# Altium project STC16F40K128.PrjPcb
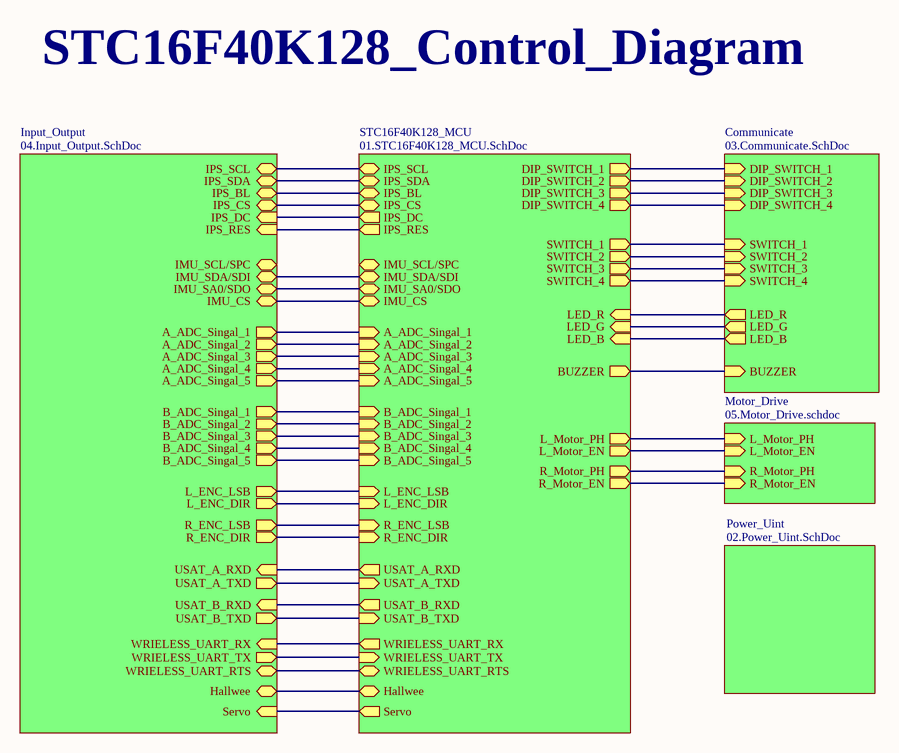
[diagram p0: 00.STC16F40K128.SchDoc]
6 sheets, 158 parts. Net scope: hierarchical (ports join the sheet entries above them; power ports are global).
Board file: STC16F40K128.PcbDoc
Sheets:
  00.STC16F40K128.SchDoc
    STC16F40K128_MCU = 01.STC16F40K128_MCU.SchDoc
    Communicate = 03.Communicate.SchDoc
    Input_Output = 04.Input_Output.SchDoc
    Power_Uint = 02.Power_Uint.SchDoc
    Motor_Drive = 05.Motor_Drive.schdoc

## Sheet 00.STC16F40K128.SchDoc: 00.STC16F40K128_Diagram
size A4; Organization: Altium Limited; Address1: L3, 12a Rodborough Rd; Address2: Frenchs Forest; Address3: NSW; Address4: Australia 2086; Revision: V1; SheetNumber: 1; SheetTotal: 6; Project: STC16F40K128

### Sub-sheets
Communicate = 03.Communicate.SchDoc: DIP_SWITCH_3 (in), DIP_SWITCH_4 (in), DIP_SWITCH_1 (in), DIP_SWITCH_2 (in), SWITCH_3 (in), SWITCH_4 (in), SWITCH_1 (in), SWITCH_2 (in), LED_R (out), LED_G (out), LED_B (out), BUZZER (in)
Input_Output = 04.Input_Output.SchDoc: IMU_SCL/SPC (bidir), IMU_SDA/SDI (bidir), IMU_SA0/SDO (bidir), IMU_CS (bidir), L_ENC_DIR (out), R_ENC_DIR (out), R_ENC_LSB (out), L_ENC_LSB (out), USAT_A_RXD (in), USAT_A_TXD (out), USAT_B_RXD (in), USAT_B_TXD (out), WRIELESS_UART_RX (in), WRIELESS_UART_TX (out), WRIELESS_UART_RTS (bidir), Hallwee (bidir), Servo (in), IPS_SCL (bidir), IPS_RES (in), IPS_SDA (bidir), IPS_CS (bidir), IPS_BL (bidir), IPS_DC (in), B_ADC_Singal_1 (out), B_ADC_Singal_2 (out), B_ADC_Singal_3 (out), B_ADC_Singal_4 (out), B_ADC_Singal_5 (out), A_ADC_Singal_1 (out), A_ADC_Singal_2 (out), A_ADC_Singal_3 (out), A_ADC_Singal_4 (out), A_ADC_Singal_5 (out)
Motor_Drive = 05.Motor_Drive.schdoc: L_Motor_PH (in), L_Motor_EN (in), R_Motor_PH (in), R_Motor_EN (in)
Power_Uint = 02.Power_Uint.SchDoc: no entries
STC16F40K128_MCU = 01.STC16F40K128_MCU.SchDoc: IMU_SCL/SPC (bidir), IMU_SDA/SDI (bidir), IMU_SA0/SDO (bidir), IMU_CS (bidir), L_ENC_LSB (in), L_ENC_DIR (in), R_ENC_LSB (in), R_ENC_DIR (in), DIP_SWITCH_1 (out), DIP_SWITCH_2 (out), DIP_SWITCH_3 (out), DIP_SWITCH_4 (out), SWITCH_1 (out), SWITCH_2 (out), SWITCH_3 (out), SWITCH_4 (out), LED_R (in), LED_G (in), LED_B (in), BUZZER (out), L_Motor_PH (out), L_Motor_EN (out), R_Motor_PH (out), R_Motor_EN (out), USAT_A_TXD (in), USAT_A_RXD (out), USAT_B_TXD (in), USAT_B_RXD (out), WRIELESS_UART_TX (in), WRIELESS_UART_RX (out), WRIELESS_UART_RTS (bidir), Hallwee (bidir), Servo (out), IPS_SCL (bidir), IPS_RES (out), IPS_SDA (bidir), IPS_CS (bidir), IPS_BL (bidir), IPS_DC (out), A_ADC_Singal_1 (in), A_ADC_Singal_2 (in), A_ADC_Singal_3 (in), A_ADC_Singal_4 (in), A_ADC_Singal_5 (in), B_ADC_Singal_1 (in), B_ADC_Singal_2 (in), B_ADC_Singal_3 (in), B_ADC_Singal_4 (in), B_ADC_Singal_5 (in)

### Nets
ADC0_P1.0: sheet STC16F40K128_MCU/B_ADC_Singal_4, sheet Input_Output/B_ADC_Singal_4
ADC1_P1.1: sheet STC16F40K128_MCU/A_ADC_Singal_3, sheet Input_Output/A_ADC_Singal_3
ADC3_P1.3: sheet STC16F40K128_MCU/A_ADC_Singal_1, sheet Input_Output/A_ADC_Singal_1
ADC4_P1.4: sheet STC16F40K128_MCU/B_ADC_Singal_3, sheet Input_Output/B_ADC_Singal_3
ADC5_P1.5: sheet STC16F40K128_MCU/A_ADC_Singal_2, sheet Input_Output/A_ADC_Singal_2
ADC6_P1.6: sheet STC16F40K128_MCU/B_ADC_Singal_2, sheet Input_Output/B_ADC_Singal_2
ADC7_P1.7: sheet STC16F40K128_MCU/B_ADC_Singal_1, sheet Input_Output/B_ADC_Singal_1
ADC10_P0.2: sheet STC16F40K128_MCU/B_ADC_Singal_5, sheet Input_Output/B_ADC_Singal_5
ADC11_P0.3: sheet STC16F40K128_MCU/A_ADC_Singal_5, sheet Input_Output/A_ADC_Singal_5
ADC13_P0.5: sheet STC16F40K128_MCU/A_ADC_Singal_4, sheet Input_Output/A_ADC_Singal_4
BUZZER_P4.0: sheet STC16F40K128_MCU/BUZZER, sheet Communicate/BUZZER
DIP_SWITCH_P0.7: sheet STC16F40K128_MCU/DIP_SWITCH_4, sheet Communicate/DIP_SWITCH_4
DIP_SWITCH_P6.0: sheet STC16F40K128_MCU/DIP_SWITCH_3, sheet Communicate/DIP_SWITCH_3
DIP_SWITCH_P6.1: sheet STC16F40K128_MCU/DIP_SWITCH_2, sheet Communicate/DIP_SWITCH_2
DIP_SWITCH_P6.2: sheet STC16F40K128_MCU/DIP_SWITCH_1, sheet Communicate/DIP_SWITCH_1
Hallwee_P7.1: sheet STC16F40K128_MCU/Hallwee, sheet Input_Output/Hallwee
IMU_P4.1: sheet STC16F40K128_MCU/IMU_SA0/SDO, sheet Input_Output/IMU_SA0/SDO
IMU_P4.2: sheet STC16F40K128_MCU/IMU_SDA/SDI, sheet Input_Output/IMU_SDA/SDI
IMU_P4.3: sheet STC16F40K128_MCU/IMU_CS, sheet Input_Output/IMU_CS
IPS_P2.0: sheet STC16F40K128_MCU/IPS_RES, sheet Input_Output/IPS_RES
IPS_P2.1: sheet STC16F40K128_MCU/IPS_DC, sheet Input_Output/IPS_DC
IPS_P2.2: sheet STC16F40K128_MCU/IPS_CS, sheet Input_Output/IPS_CS
IPS_P2.3: sheet STC16F40K128_MCU/IPS_SDA, sheet Input_Output/IPS_SDA
IPS_P2.5: sheet STC16F40K128_MCU/IPS_SCL, sheet Input_Output/IPS_SCL
IPS_P2.7: sheet STC16F40K128_MCU/IPS_BL, sheet Input_Output/IPS_BL
L_EN_P6.6: sheet STC16F40K128_MCU/L_Motor_EN, sheet Motor_Drive/L_Motor_EN
L_ENC_P0.4: sheet STC16F40K128_MCU/L_ENC_LSB, sheet Input_Output/L_ENC_LSB
L_ENC_P5.2: sheet STC16F40K128_MCU/L_ENC_DIR, sheet Input_Output/L_ENC_DIR
L_PH_P6.7: sheet STC16F40K128_MCU/L_Motor_PH, sheet Motor_Drive/L_Motor_PH
LED_B_P5.1: sheet STC16F40K128_MCU/LED_B, sheet Communicate/LED_B
LED_G_P3.5: sheet STC16F40K128_MCU/LED_G, sheet Communicate/LED_G
LED_R_P7.0: sheet STC16F40K128_MCU/LED_R, sheet Communicate/LED_R
R_EN_P6.4: sheet STC16F40K128_MCU/R_Motor_EN, sheet Motor_Drive/R_Motor_EN
R_ENC_P3.4: sheet STC16F40K128_MCU/R_ENC_LSB, sheet Input_Output/R_ENC_LSB
R_ENC_P5.0: sheet STC16F40K128_MCU/R_ENC_DIR, sheet Input_Output/R_ENC_DIR
R_PH_P6.5: sheet STC16F40K128_MCU/R_Motor_PH, sheet Motor_Drive/R_Motor_PH
RTS_P2.6: sheet STC16F40K128_MCU/WRIELESS_UART_RTS, sheet Input_Output/WRIELESS_UART_RTS
Servo_P3.3: sheet STC16F40K128_MCU/Servo, sheet Input_Output/Servo
SWITCH_P7.4: sheet STC16F40K128_MCU/SWITCH_1, sheet Communicate/SWITCH_1
SWITCH_P7.5: sheet STC16F40K128_MCU/SWITCH_2, sheet Communicate/SWITCH_2
SWITCH_P7.6: sheet STC16F40K128_MCU/SWITCH_3, sheet Communicate/SWITCH_3
SWITCH_P7.7: sheet STC16F40K128_MCU/SWITCH_4, sheet Communicate/SWITCH_4
UART1_RXD_P3.6: sheet STC16F40K128_MCU/USAT_A_TXD, sheet Input_Output/USAT_A_TXD
UART1_TXD_P3.7: sheet STC16F40K128_MCU/USAT_A_RXD, sheet Input_Output/USAT_A_RXD
UART2_RX_P4.6: sheet STC16F40K128_MCU/USAT_B_TXD, sheet Input_Output/USAT_B_TXD
UART2_TX_P4.7: sheet STC16F40K128_MCU/USAT_B_RXD, sheet Input_Output/USAT_B_RXD
UART3_RX_P0.0: sheet STC16F40K128_MCU/WRIELESS_UART_TX, sheet Input_Output/WRIELESS_UART_TX
UART3_TX_P0.1: sheet STC16F40K128_MCU/WRIELESS_UART_RX, sheet Input_Output/WRIELESS_UART_RX

### Notes on the sheet
- STC16F40K128_Control_Diagram
- Title：
- Size:
- Project：
- A4
- Date:
- Revision:
- Author：
- Haibara
- Sheet:
- of:

## Sheet 01.STC16F40K128_MCU.SchDoc: 01.STC16F40K128_MCU
size A4; Organization: Altium Limited; Address1: L3, 12a Rodborough Rd; Address2: Frenchs Forest; Address3: NSW; Address4: Australia 2086; Revision: V1; SheetNumber: 2; SheetTotal: 6; Project: STC16F40K128
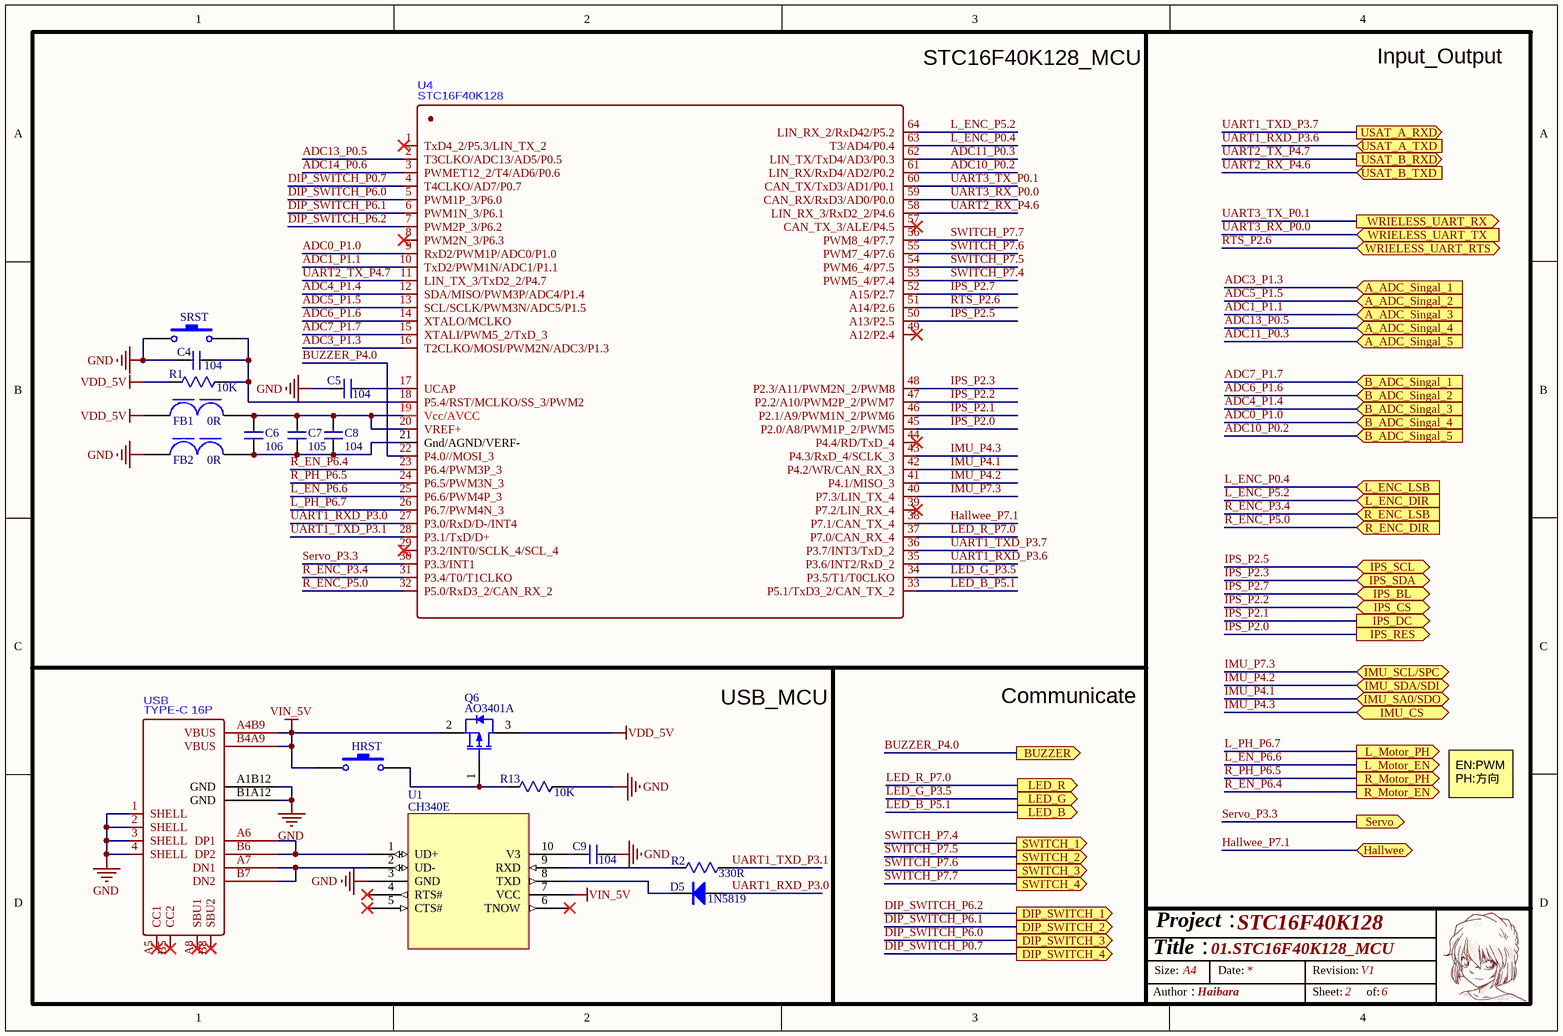
[diagram p1: 01.STC16F40K128_MCU.SchDoc]

### Parts
C4  104  [C0603]
C5  104  [C0603]
C6  106  [C0603]
C7  105  [C0603]
C8  104  [C0603]
C9  104  [C0603]
D5  1N5819  [SOD-523]
FB1  0R  [0805 磁珠 FB3]
FB2  0R  [0805 磁珠 FB3]
HRST  SW-PB  [TSW SMD-3*6*2.5]  (value not drawn)
Q6  AO3401A  [AO-SOT-23-3L_V]
R1  10K  [R0603]
R2  330R  [R0603]
R13  10K  [R0603]
SRST  SW-PB  [TSW SMD-3*6*2.5]  (value not drawn)
U1  CH340E  [MSOP10]
U4  STC16F40K128  [LQFP-64_L10.0-W10.0-P0.50-LS12.0-BL]
USB  TYPE-C 16P  [USB-C-SMD_TYPE-C16PIN_C668624]

### Ports
A_ADC_Singal_1 (in), A_ADC_Singal_2 (in), A_ADC_Singal_3 (in), A_ADC_Singal_4 (in), A_ADC_Singal_5 (in), B_ADC_Singal_1 (in), B_ADC_Singal_2 (in), B_ADC_Singal_3 (in), B_ADC_Singal_4 (in), B_ADC_Singal_5 (in), BUZZER (out), DIP_SWITCH_1 (out), DIP_SWITCH_2 (out), DIP_SWITCH_3 (out), DIP_SWITCH_4 (out), Hallwee (bidir), IMU_CS (bidir), IMU_SA0/SDO (bidir), IMU_SCL/SPC (bidir), IMU_SDA/SDI (bidir), IPS_BL (bidir), IPS_CS (bidir), IPS_DC (out), IPS_RES (out), IPS_SCL (bidir), IPS_SDA (bidir), L_ENC_DIR (in), L_ENC_LSB (in), L_Motor_EN (out), L_Motor_PH (out), LED_B (out), LED_G (out), LED_R (out), R_ENC_DIR (in), R_ENC_LSB (in), R_Motor_EN (out), R_Motor_PH (out), Servo (out), SWITCH_1 (out), SWITCH_2 (out), SWITCH_3 (out), SWITCH_4 (out), USAT_A_RXD (out), USAT_A_TXD (in), USAT_B_RXD (out), USAT_B_TXD (in), WRIELESS_UART_RTS (bidir), WRIELESS_UART_RX (out), WRIELESS_UART_TX (in)

### Nets
GND: C4.1 C5.2 C9.1 FB2.1 R13.2 SRST.1 U1.3(GND) USB.1(SHELL) USB.2(SHELL) USB.3(SHELL) USB.4(SHELL) USB.A1B12(GND) USB.B1A12(GND)
VDD_5V: FB1.1 Q6.3(DRAIN) R1.1
VIN_5V: HRST.1 Q6.2(SOURCE) U1.7(VCC) USB.A4B9(VBUS) USB.B4A9(VBUS)
ADC0_P1.0: U4.9(RxD2/PWM1P/ADC0/P1.0) ; port B_ADC_Singal_4
ADC1_P1.1: U4.10(TxD2/PWM1N/ADC1/P1.1) ; port A_ADC_Singal_3
ADC3_P1.3: U4.16(T2CLKO/MOSI/PWM2N/ADC3/P1.3) ; port A_ADC_Singal_1
ADC4_P1.4: U4.12(SDA/MISO/PWM3P/ADC4/P1.4) ; port B_ADC_Singal_3
ADC5_P1.5: U4.13(SCL/SCLK/PWM3N/ADC5/P1.5) ; port A_ADC_Singal_2
ADC6_P1.6: U4.14(XTALO/MCLKO) ; port B_ADC_Singal_2
ADC7_P1.7: U4.15(XTALI/PWM5_2/TxD_3) ; port B_ADC_Singal_1
ADC10_P0.2: U4.61(LIN_RX/RxD4/AD2/P0.2) ; port B_ADC_Singal_5
ADC11_P0.3: U4.62(LIN_TX/TxD4/AD3/P0.3) ; port A_ADC_Singal_5
ADC13_P0.5: U4.2(T3CLKO/ADC13/AD5/P0.5) ; port A_ADC_Singal_4
ADC14_P0.6: U4.3(PWMET12_2/T4/AD6/P0.6)
BUZZER_P4.0: U4.22(P4.0//MOSI_3) ; port BUZZER
DIP_SWITCH_P0.7: U4.4(T4CLKO/AD7/P0.7) ; port DIP_SWITCH_4
DIP_SWITCH_P6.0: U4.5(PWM1P_3/P6.0) ; port DIP_SWITCH_3
DIP_SWITCH_P6.1: U4.6(PWM1N_3/P6.1) ; port DIP_SWITCH_2
DIP_SWITCH_P6.2: U4.7(PWM2P_3/P6.2) ; port DIP_SWITCH_1
Hallwee_P7.1: U4.38(P7.1/CAN_TX_4) ; port Hallwee
IMU_P4.1: U4.42(P4.2/WR/CAN_RX_3) ; port IMU_SA0/SDO
IMU_P4.2: U4.41(P4.1/MISO_3) ; port IMU_SDA/SDI
IMU_P4.3: U4.43(P4.3/RxD_4/SCLK_3) ; port IMU_CS
IMU_P7.3: U4.40(P7.3/LIN_TX_4) ; port IMU_SCL/SPC
IPS_P2.0: U4.45(P2.0/A8/PWM1P_2/PWM5) ; port IPS_RES
IPS_P2.1: U4.46(P2.1/A9/PWM1N_2/PWM6) ; port IPS_DC
IPS_P2.2: U4.47(P2.2/A10/PWM2P_2/PWM7) ; port IPS_CS
IPS_P2.3: U4.48(P2.3/A11/PWM2N_2/PWM8) ; port IPS_SDA
IPS_P2.5: U4.50(A13/P2.5) ; port IPS_SCL
IPS_P2.7: U4.52(A15/P2.7) ; port IPS_BL
L_EN_P6.6: U4.25(P6.6/PWM4P_3) ; port L_Motor_EN
L_ENC_P0.4: U4.63(T3/AD4/P0.4) ; port L_ENC_LSB
L_ENC_P5.2: U4.64(LIN_RX_2/RxD42/P5.2) ; port L_ENC_DIR
L_PH_P6.7: U4.26(P6.7/PWM4N_3) ; port L_Motor_PH
LED_B_P5.1: U4.33(P5.1/TxD3_2/CAN_TX_2) ; port LED_B
LED_G_P3.5: U4.34(P3.5/T1/T0CLKO) ; port LED_G
LED_R_P7.0: U4.37(P7.0/CAN_RX_4) ; port LED_R
R_EN_P6.4: U4.23(P6.4/PWM3P_3) ; port R_Motor_EN
R_ENC_P3.4: U4.31(P3.4/T0/T1CLKO) ; port R_ENC_LSB
R_ENC_P5.0: U4.32(P5.0/RxD3_2/CAN_RX_2) ; port R_ENC_DIR
R_PH_P6.5: U4.24(P6.5/PWM3N_3) ; port R_Motor_PH
RTS_P2.6: U4.51(A14/P2.6) ; port WRIELESS_UART_RTS
Servo_P3.3: U4.30(P3.3/INT1) ; port Servo
SWITCH_P7.4: U4.53(PWM5_4/P7.4) ; port SWITCH_1
SWITCH_P7.5: U4.54(PWM6_4/P7.5) ; port SWITCH_2
SWITCH_P7.6: U4.55(PWM7_4/P7.6) ; port SWITCH_3
SWITCH_P7.7: U4.56(PWM8_4/P7.7) ; port SWITCH_4
UART1_RXD_P3.0: D5.1(A) U4.27(P3.0/RxD/D-/INT4)
UART1_RXD_P3.6: U4.35(P3.6/INT2/RxD_2) ; port USAT_A_TXD
UART1_TXD_P3.1: R2.1 U4.28(P3.1/TxD/D+)
UART1_TXD_P3.7: U4.36(P3.7/INT3/TxD_2) ; port USAT_A_RXD
UART2_RX_P4.6: U4.58(LIN_RX_3/RxD2_2/P4.6) ; port USAT_B_TXD
UART2_TX_P4.7: U4.11(LIN_TX_3/TxD2_2/P4.7) ; port USAT_B_RXD
UART3_RX_P0.0: U4.59(CAN_RX/RxD3/AD0/P0.0) ; port WRIELESS_UART_TX
UART3_TX_P0.1: U4.60(CAN_TX/TxD3/AD1/P0.1) ; port WRIELESS_UART_RX
NetC4_2: C4.2 R1.2 SRST.2 U4.18(P5.4/RST/MCLKO/SS_3/PWM2)
NetC5_1: C5.1 U4.17(UCAP)
NetC6_1: C6.1 C7.1 C8.1 FB2.2 U4.21(Gnd/AGND/VERF-)
NetC6_2: C6.2 C7.2 C8.2 FB1.2 U4.19(Vcc/AVCC) U4.20(VREF+)
NetC9_2: C9.2 U1.10(V3)
NetD5_2: D5.2(K) U1.8(TXD)
NetHRST_2: HRST.2 Q6.1(GATE) R13.1
NetR2_2: R2.2 U1.9(RXD)
NetU1_1: U1.1(UD+) USB.A6(DP1) USB.B6(DP2)
NetU1_2: U1.2(UD-) USB.A7(DN1) USB.B7(DN2)

Not connected (* = marked no-connect by the designer): U1 4(RTS#)* 5(CTS#)* 6(TNOW)*; U4 1(TxD4_2/P5.3/LIN_TX_2)* 8(PWM2N_3/P6.3)* 29(P3.2/INT0/SCLK_4/SCL_4)* 39(P7.2/LIN_RX_4)* 44(P4.4/RD/TxD_4)* 49(A12/P2.4)* 57(CAN_TX_3/ALE/P4.5)*; USB A5(CC1)* A8(SBU1)* B5(CC2)* B8(SBU2)*

### Notes on the sheet
- STC16F40K128_MCU
- Input_Output
- USB_MCU
- Communicate
- EN:PWM
  PH:方向
- Title：
- Size:
- Project：
- A4
- Date:
- Revision:
- Author：
- Haibara
- Sheet:
- of:

### Library data of the parts
C4-C9 = 电容
D5 = 1N5819: 肖特基二极管; 淘宝ID: 黄晶宝石; 属性: 40V/2A; BOM名称: 肖特基二极管; 欢迎光临: https://shop463601444.taobao.com
FB1 FB2 = FB
HRST SRST = SW-PB: Switch; Published: 24-Mar-1999; LatestRevisionDate: 17-Jul-2002; LatestRevisionNote: Re-released for DXP Platform.; PackageReference: SPST-2; Publisher: Altium Limited; PackageDescription: Switch; 2 Leads
Q6 = CMP-2000-05778-1: P-Channel MOSFET, 30 V, 4 A, -55 to 150 degC, 3-Pin SOT-23-3L, RoHS, Tape and Reel; Manufacturer: Alpha and Omega; Output Power (Max): NotRequiredW; Power Dissipation: 1.4W; Rad Hardened: No; Drain Efficiency: NotRequired%; Drain-Source On-Volt: 30V; Noise Figure: NotRequireddB; Frequency (Max): NotRequiredMHz; Number of  Elements: 1; Gate-Source Voltage (Max): ?12V; Drain Current (Max): 4A; Channel Mode: Enhancement; Drain-Source On-Res: 0.044ohm; Type: PowerMOSFET; Polarity: P; Package URL: http://www.aosmd.com/res/packaging_information/SOT-23-3L.pdf; Datasheet URL: http://www.aosmd.com/res/data_sheets/AO3401A.pdf; Package Type: SOT-23; Package Description: 3-Pin Small Outline Transistor, Body 2.95 x 1.6 mm, Pitch 0.95 mm; Mounting: SurfaceMount; Manufacturer URL: http://www.aosmd.com/; Continuous Drain Current: 4A; Package Reference: SOT-23-3L; Mounting Technology: SurfaceMount; Operating Temperature Classification: Military; Power Gain: NotRequireddB; Datasheet Version: Rev. 3, 03/2011; Operating Temp Range: -55Cto150C; Pin Count: 3
R1 R2 R13 = 电阻
U1 = CH340E: USB to TTL Serial / UART

## Sheet 03.Communicate.SchDoc: 03.Communicate
size A4; Organization: Altium Limited; Address1: L3, 12a Rodborough Rd; Address2: Frenchs Forest; Address3: NSW; Address4: Australia 2086; Revision: V1; SheetNumber: 4; SheetTotal: 6; Project: STC16F40K128
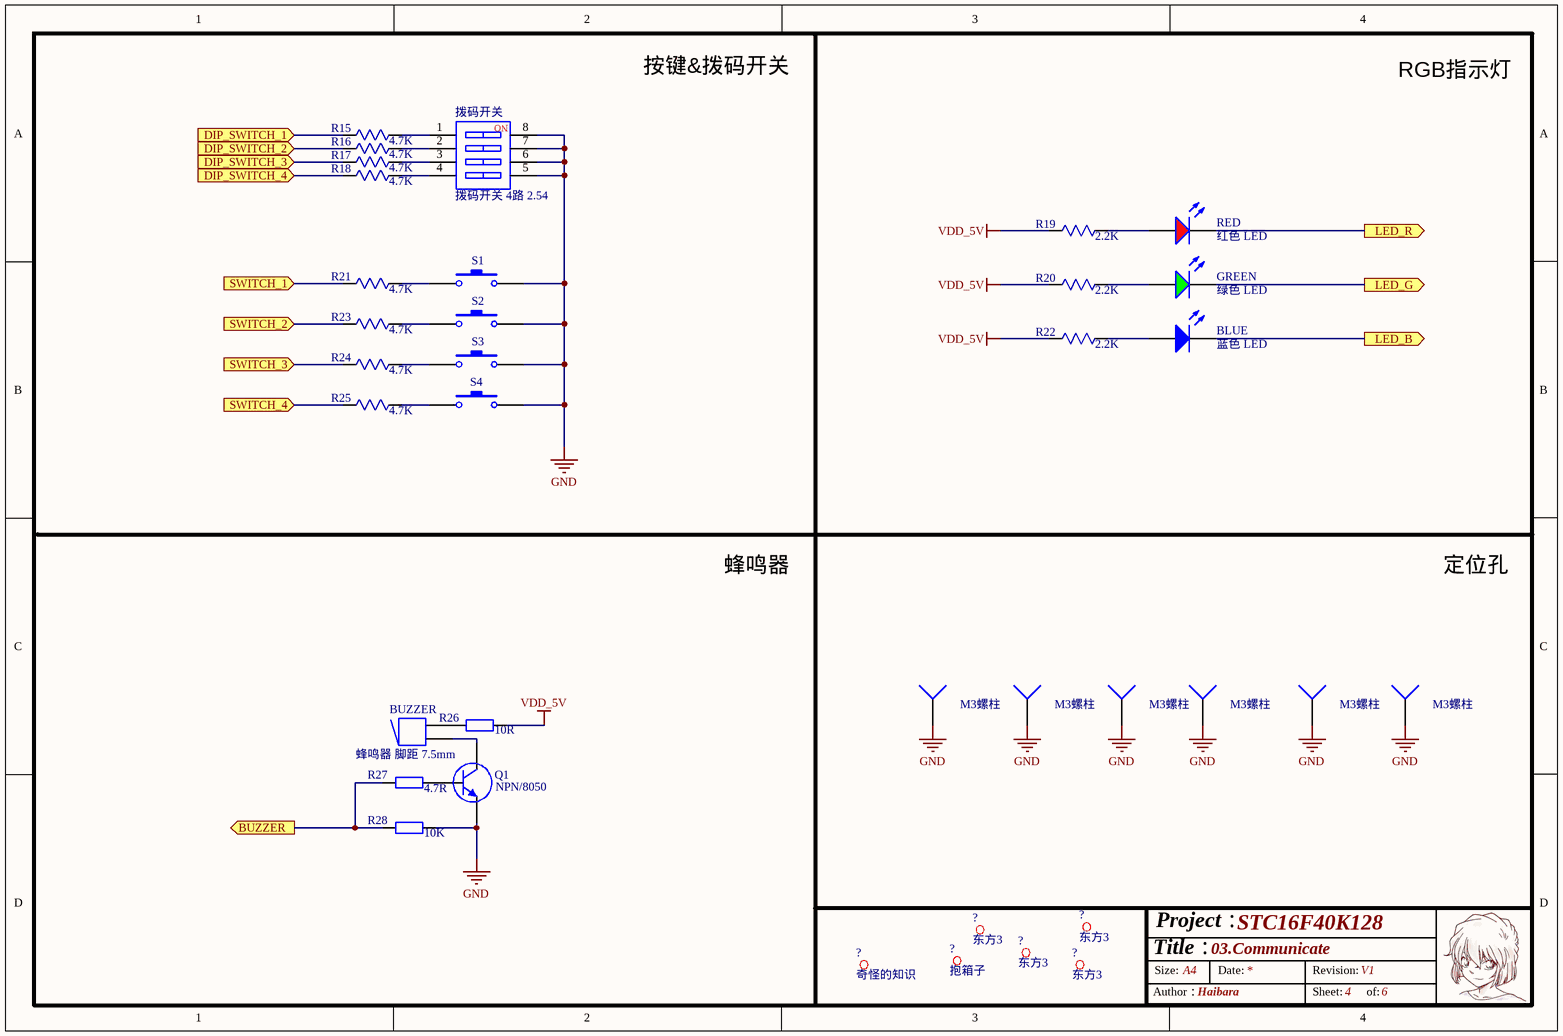
[diagram p2: 03.Communicate.SchDoc]

### Parts
(Parts that share a designator on the sheet are numbered #1, #2 ... from top to bottom, then left to right.)
?#1  东方3  [FKt]
?#2  东方3  [ESD]
?#3  奇怪的知识  [奇怪的知识]
?#4  抱箱子  [抱箱子_大]
?#5  东方3  [IMPORTED_IMAGE - duplicate15]
?#6  东方3  [IEC_HotSurface_Small]
BLUE  蓝色 LED  [0603 LED B]
BUZZER  蜂鸣器 脚距 7.5mm  [蜂鸣器5.5mm脚距]
GREEN  绿色 LED  [0603 LED G]
J1  M3螺柱  [MTGP720H320V6P - duplicate]
J2  M3螺柱  [MTGP720H320V6P - duplicate]
J3  M3螺柱  [MTGP720H320V6P - duplicate]
J4  M3螺柱  [MTGP720H320V6P - duplicate]
J5  M3螺柱  [MTGP720H320V6P - duplicate]
J6  M3螺柱  [MTGP720H320V6P - duplicate]
Q1  NPN/8050  [SOT232-3 三极管]
R15  4.7K  [R0603]
R16  4.7K  [R0603]
R17  4.7K  [R0603]
R18  4.7K  [R0603]
R19  2.2K  [R0603]
R20  2.2K  [R0603]
R21  4.7K  [R0603]
R22  2.2K  [R0603]
R23  4.7K  [R0603]
R24  4.7K  [R0603]
R25  4.7K  [R0603]
R26  value 10R  [0603 电阻 R3]  (hidden comment: 4.7K)
R27  value 4.7R  [0603 电阻 R3]  (hidden comment: 4.7K)
R28  value 10K  [0603 电阻 R3]  (hidden comment: 4.7K)
RED  红色 LED  [0603 LED R]
S1  SW-PB  [TSW SMD-3*6*2.5]  (value not drawn)
S2  SW-PB  [TSW SMD-3*6*2.5]  (value not drawn)
S3  SW-PB  [TSW SMD-3*6*2.5]  (value not drawn)
S4  SW-PB  [TSW SMD-3*6*2.5]  (value not drawn)
拨码开关  拨码开关 4路 2.54  [CSW DIP-2P_G]

### Ports
BUZZER (out), DIP_SWITCH_1 (in), DIP_SWITCH_2 (in), DIP_SWITCH_3 (in), DIP_SWITCH_4 (in), LED_B (out), LED_G (out), LED_R (out), SWITCH_1 (in), SWITCH_2 (in), SWITCH_3 (in), SWITCH_4 (in)

### Nets
GND: J1.1 J2.1 J3.1 J4.1 J5.1 J6.1 Q1.2(E) R28.2 S1.2 S2.2 S3.2 S4.2 拨码开关.5 拨码开关.6 拨码开关.7 拨码开关.8
VDD_5V: R19.1 R20.1 R22.1 R26.2
BUZZER_P4.0: R27.1 R28.1 ; port BUZZER
DIP_SWITCH_P0.7: R18.1 ; port DIP_SWITCH_4
DIP_SWITCH_P6.0: R17.1 ; port DIP_SWITCH_3
DIP_SWITCH_P6.1: R16.1 ; port DIP_SWITCH_2
DIP_SWITCH_P6.2: R15.1 ; port DIP_SWITCH_1
LED_B_P5.1: BLUE.2 ; port LED_B
LED_G_P3.5: GREEN.2 ; port LED_G
LED_R_P7.0: RED.2 ; port LED_R
SWITCH_P7.4: R21.1 ; port SWITCH_1
SWITCH_P7.5: R23.1 ; port SWITCH_2
SWITCH_P7.6: R24.1 ; port SWITCH_3
SWITCH_P7.7: R25.1 ; port SWITCH_4
NetBLUE_1: BLUE.1 R22.2
NetBUZZER_1: BUZZER.1 R26.1
NetBUZZER_2: BUZZER.2 Q1.3(C)
NetGREEN_1: GREEN.1 R20.2
NetQ1_1: Q1.1(B) R27.2
NetR15_2: R15.2 拨码开关.1
NetR16_2: R16.2 拨码开关.2
NetR17_2: R17.2 拨码开关.3
NetR18_2: R18.2 拨码开关.4
NetR19_2: R19.2 RED.1
NetR21_2: R21.2 S1.1
NetR23_2: R23.2 S2.1
NetR24_2: R24.2 S3.1
NetR25_2: R25.2 S4.1

### Notes on the sheet
- 按键&拨码开关
- RGB指示灯
- 蜂鸣器
- 定位孔
- Title：
- Size:
- Project：
- A4
- Date:
- Revision:
- Author：
- Haibara
- Sheet:
- of:
- (in symbol CSW-4P) NO

### Library data of the parts
BLUE = 蓝灯: 发光二极管; ComponentLink1Description: 供应商链接; ComponentLink1URL: http://www.szlcsc.com/product/details_2666.html; Package: 0805; Supplier: LC; SuppliersPartNumber: C2293
BUZZER = Buzzer: Magnetic Transducer Buzzer; Published: 24-Mar-1999; LatestRevisionDate: 17-Dec-2003; LatestRevisionNote: Schematic revised, PCB Footprint replaced.; DatasheetVersion: 17-Dec-2003; PackageReference: ABSM-1574; Publisher: Altium Limited; PackageDescription: Magnetic Transducer Buzzer; ComponentLink1Description: Manufacturer Link; ComponentLink1URL: http://www.megastar.com/linecard/buzzmode/index.php
GREEN = 绿灯: 发光二极管; ComponentLink1Description: 供应商链接; ComponentLink1URL: http://www.szlcsc.com/product/details_2670.html; Package: 0805; Supplier: LC; SuppliersPartNumber: C2297
J1-J6 = Socket: LatestRevisionDate: 17-Jul-2002; LatestRevisionNote: Re-released for DXP Platform.; Publisher: Altium Limited
R15-R25 = 电阻
R26-R28 = Res2: Resistor; Published: 8-Jun-2000; LatestRevisionDate: 17-Jul-2002; LatestRevisionNote: Re-released for DXP Platform.; PackageReference: AXIAL-0.4; Publisher: Altium Limited; PackageDescription: Axial Device, Thru-Hole; 2 Leads; 0.4 in Pin Spacing
RED = 红灯: 发光二极管; ComponentLink1Description: 供应商链接; ComponentLink1URL: http://www.szlcsc.com/product/details_2668.html; Package: 0805; Supplier: LC; SuppliersPartNumber: C2295
S1-S4 = SW-PB: Switch; Published: 24-Mar-1999; LatestRevisionDate: 17-Jul-2002; LatestRevisionNote: Re-released for DXP Platform.; PackageReference: SPST-2; Publisher: Altium Limited; PackageDescription: Switch; 2 Leads
拨码开关 = CSW-4P: 4路编码开关; 版权归属: 源创客; BOM名称: 4路编码开关; 学习资源: www.ooocke.com

## Sheet 04.Input_Output.SchDoc: 04.Input_Output
size A4; Organization: Altium Limited; Address1: L3, 12a Rodborough Rd; Address2: Frenchs Forest; Address3: NSW; Address4: Australia 2086; Revision: V1; SheetNumber: 5; SheetTotal: 6; Project: STC16F40K128
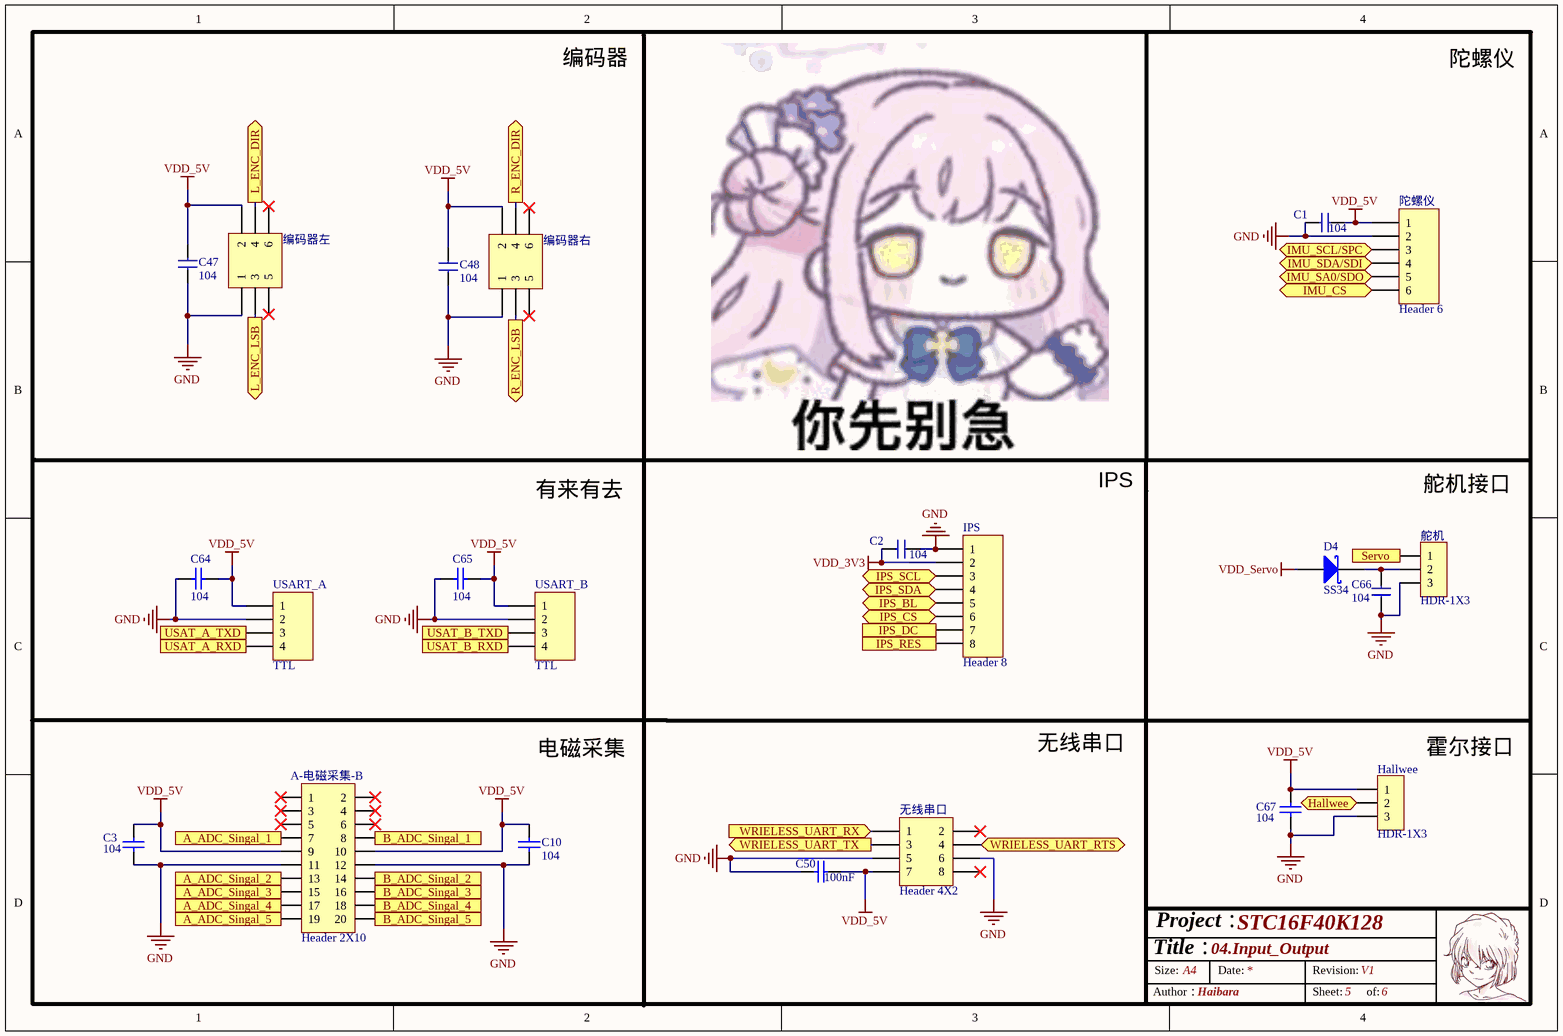
[diagram p3: 04.Input_Output.SchDoc]

### Parts
A-电磁采集-B  Header 2X10  [HDR2.54-LI-2x10P]
C1  104  [C0603]
C2  104  [C0603]
C3  104  [0603 电容 C3]
C10  104  [0603 电容 C3]
C47  104  [C0603]
C48  104  [C0603]
C50  100nF  [0603 电容 C3]
C64  104  [0603 电容 C3]
C65  104  [0603 电容 C3]
C66  104  [C0603]
C67  104  [0603 电容 C3]
D4  SS34  [SMA]
Hallwee  HDR-1X3  [HDR2.54-M-LI-3P]
IPS  Header 8  [HDR2.54-M-LI-8P]
USART_A  TTL  [HDR2.54-M-LI-4P]
USART_B  TTL  [HDR2.54-M-LI-4P]
无线串口  Header 4X2  [2.54mm 4P*2排母]
编码器右  Header 3X2  [DC-2.54-L-Z-6P]  (value not drawn)
编码器左  Header 3X2  [DC-2.54-L-Z-6P]  (value not drawn)
舵机  HDR-1X3  [HDR2.54-M-LI-3P]
陀螺仪  Header 6  [MX 1.25-WS-6P]

### Ports
A_ADC_Singal_1 (out), A_ADC_Singal_2 (out), A_ADC_Singal_3 (out), A_ADC_Singal_4 (out), A_ADC_Singal_5 (out), B_ADC_Singal_1 (out), B_ADC_Singal_2 (out), B_ADC_Singal_3 (out), B_ADC_Singal_4 (out), B_ADC_Singal_5 (out), Hallwee (bidir), IMU_CS (bidir), IMU_SA0/SDO (bidir), IMU_SCL/SPC (bidir), IMU_SDA/SDI (bidir), IPS_BL (bidir), IPS_CS (bidir), IPS_DC (out), IPS_RES (out), IPS_SCL (bidir), IPS_SDA (bidir), L_ENC_DIR (out), L_ENC_LSB (out), R_ENC_DIR (out), R_ENC_LSB (out), Servo (in), USAT_A_RXD (in), USAT_A_TXD (out), USAT_B_RXD (in), USAT_B_TXD (out), WRIELESS_UART_RTS (bidir), WRIELESS_UART_RX (in), WRIELESS_UART_TX (out)

### Nets
GND: A-电磁采集-B.11 A-电磁采集-B.12 C1.2 C2.2 C3.1 C10.1 C47.1 C48.1 C50.2 C64.2 C65.2 C66.1 C67.1 Hallwee.3 IPS.1 USART_A.2 USART_B.2 无线串口.5 无线串口.6 编码器右.1 编码器左.1 舵机.3 陀螺仪.2
VDD_3V3: C2.1 IPS.2
VDD_5V: A-电磁采集-B.9 A-电磁采集-B.10 C1.1 C3.2 C10.2 C47.2 C48.2 C50.1 C64.1 C65.1 C67.2 Hallwee.1 USART_A.1 USART_B.1 无线串口.7 编码器右.2 编码器左.2 陀螺仪.1
VDD_Servo: D4.1(A)
ADC0_P1.0: A-电磁采集-B.18 ; port B_ADC_Singal_4
ADC1_P1.1: A-电磁采集-B.15 ; port A_ADC_Singal_3
ADC3_P1.3: A-电磁采集-B.7 ; port A_ADC_Singal_1
ADC4_P1.4: A-电磁采集-B.16 ; port B_ADC_Singal_3
ADC5_P1.5: A-电磁采集-B.13 ; port A_ADC_Singal_2
ADC6_P1.6: A-电磁采集-B.14 ; port B_ADC_Singal_2
ADC7_P1.7: A-电磁采集-B.8 ; port B_ADC_Singal_1
ADC10_P0.2: A-电磁采集-B.20 ; port B_ADC_Singal_5
ADC11_P0.3: A-电磁采集-B.19 ; port A_ADC_Singal_5
ADC13_P0.5: A-电磁采集-B.17 ; port A_ADC_Singal_4
Hallwee_P7.1: Hallwee.2 ; port Hallwee
IMU_P4.1: 陀螺仪.5 ; port IMU_SA0/SDO
IMU_P4.2: 陀螺仪.4 ; port IMU_SDA/SDI
IMU_P4.3: 陀螺仪.6 ; port IMU_CS
IPS_P2.0: IPS.8 ; port IPS_RES
IPS_P2.1: IPS.7 ; port IPS_DC
IPS_P2.2: IPS.6 ; port IPS_CS
IPS_P2.3: IPS.4 ; port IPS_SDA
IPS_P2.5: IPS.3 ; port IPS_SCL
IPS_P2.7: IPS.5 ; port IPS_BL
L_ENC_P0.4: 编码器左.3 ; port L_ENC_LSB
L_ENC_P5.2: 编码器左.4 ; port L_ENC_DIR
R_ENC_P3.4: 编码器右.3 ; port R_ENC_LSB
R_ENC_P5.0: 编码器右.4 ; port R_ENC_DIR
RTS_P2.6: 无线串口.4 ; port WRIELESS_UART_RTS
Servo_P3.3: 舵机.1 ; port Servo
UART1_RXD_P3.6: USART_A.3 ; port USAT_A_TXD
UART1_TXD_P3.7: USART_A.4 ; port USAT_A_RXD
UART2_RX_P4.6: USART_B.3 ; port USAT_B_TXD
UART2_TX_P4.7: USART_B.4 ; port USAT_B_RXD
UART3_RX_P0.0: 无线串口.3 ; port WRIELESS_UART_TX
UART3_TX_P0.1: 无线串口.1 ; port WRIELESS_UART_RX
NetC66_2: C66.2 D4.2(K) 舵机.2
Net陀螺仪_3: 陀螺仪.3 ; port IMU_SCL/SPC

Not connected (* = marked no-connect by the designer): A-电磁采集-B 1* 2* 3* 4* 5* 6*; 无线串口 2* 8*; 编码器右 5* 6*; 编码器左 5* 6*

### Notes on the sheet
- Labels drawn without touching a wire or pin: IPS, 无线串口, 有来有去, 电磁采集, 编码器, 舵机接口, 陀螺仪, 霍尔接口
- Title：
- Size:
- Project：
- A4
- Date:
- Revision:
- Author：
- Haibara
- Sheet:
- of:

### Library data of the parts
A-电磁采集-B = Header 10X2: 10*2P接插件; 版权归属: 源创客; BOM名称: 10*2P接插件; 学习资源: www.ooocke.com
C1 C2 C47 C48 C66 = 电容
C3 C10 C50 C64 C65 C67 = Cap: Capacitor; Published: 8-Jun-2000; LatestRevisionDate: 17-Jul-2002; LatestRevisionNote: Re-released for DXP Platform.; PackageReference: RAD-0.3; Publisher: Altium Limited; PackageDescription: Radial Cap, Thru-Hole; 2 Leads; 0.3 in Pin Spacing
D4 = 肖特基二极管: Schottky Rectifier; Note: Terminal 2 is the TAB and is electrically connected to the cathode; Published: 8-Jun-2000; LatestRevisionDate: 17-Jul-2002; LatestRevisionNote: Re-released for DXP Platform.; DatasheetVersion: PD-2.057B; PackageVersion: Feb-1998; PackageReference: TO-220AC; Publisher: Altium Limited; PackageDescription: TO, Thru-Hole, Vertical, Heatsink Mounted; 3 In-Line Leads (1 Absent); Pitch 2.54 mm; ComponentLink1Description: Manufacturer Link; ComponentLink1URL: http://www.irf.com/; ComponentLink2Description: Datasheet; ComponentLink2URL: http://www.irf.com/product-info/datasheets/data/10tq.pdf
Hallwee 舵机 = Header 3: 3P接插件; 版权归属: 封装库来自淘宝 ID：黄晶宝石; BOM名称: 3P接插件; 学习资源: https://shop463601444.taobao.com
IPS = Header 8: Header, 8-Pin; LatestRevisionDate: 17-Jul-2002; LatestRevisionNote: Re-released for DXP Platform.; Publisher: Altium Limited
USART_A USART_B = Header 4: Header, 4-Pin; LatestRevisionDate: 17-Jul-2002; LatestRevisionNote: Re-released for DXP Platform.; Publisher: Altium Limited
无线串口 = Header 4X2: Header, 4-Pin, Dual row; LatestRevisionDate: 17-Jul-2002; LatestRevisionNote: Re-released for DXP Platform.; Publisher: Altium Limited
编码器右 编码器左 = Header 3X2: Header, 3-Pin, Dual row; LatestRevisionDate: 17-Jul-2002; LatestRevisionNote: Re-released for DXP Platform.; Publisher: Altium Limited
陀螺仪 = Header 6: Header, 6-Pin; LatestRevisionDate: 17-Jul-2002; LatestRevisionNote: Re-released for DXP Platform.; Publisher: Altium Limited

## Sheet 02.Power_Uint.SchDoc: 02.Power_Uint
size A4; Organization: Altium Limited; Address1: L3, 12a Rodborough Rd; Address2: Frenchs Forest; Address3: NSW; Address4: Australia 2086; Revision: V1; SheetNumber: 3; SheetTotal: 6; Project: STC16F40K128
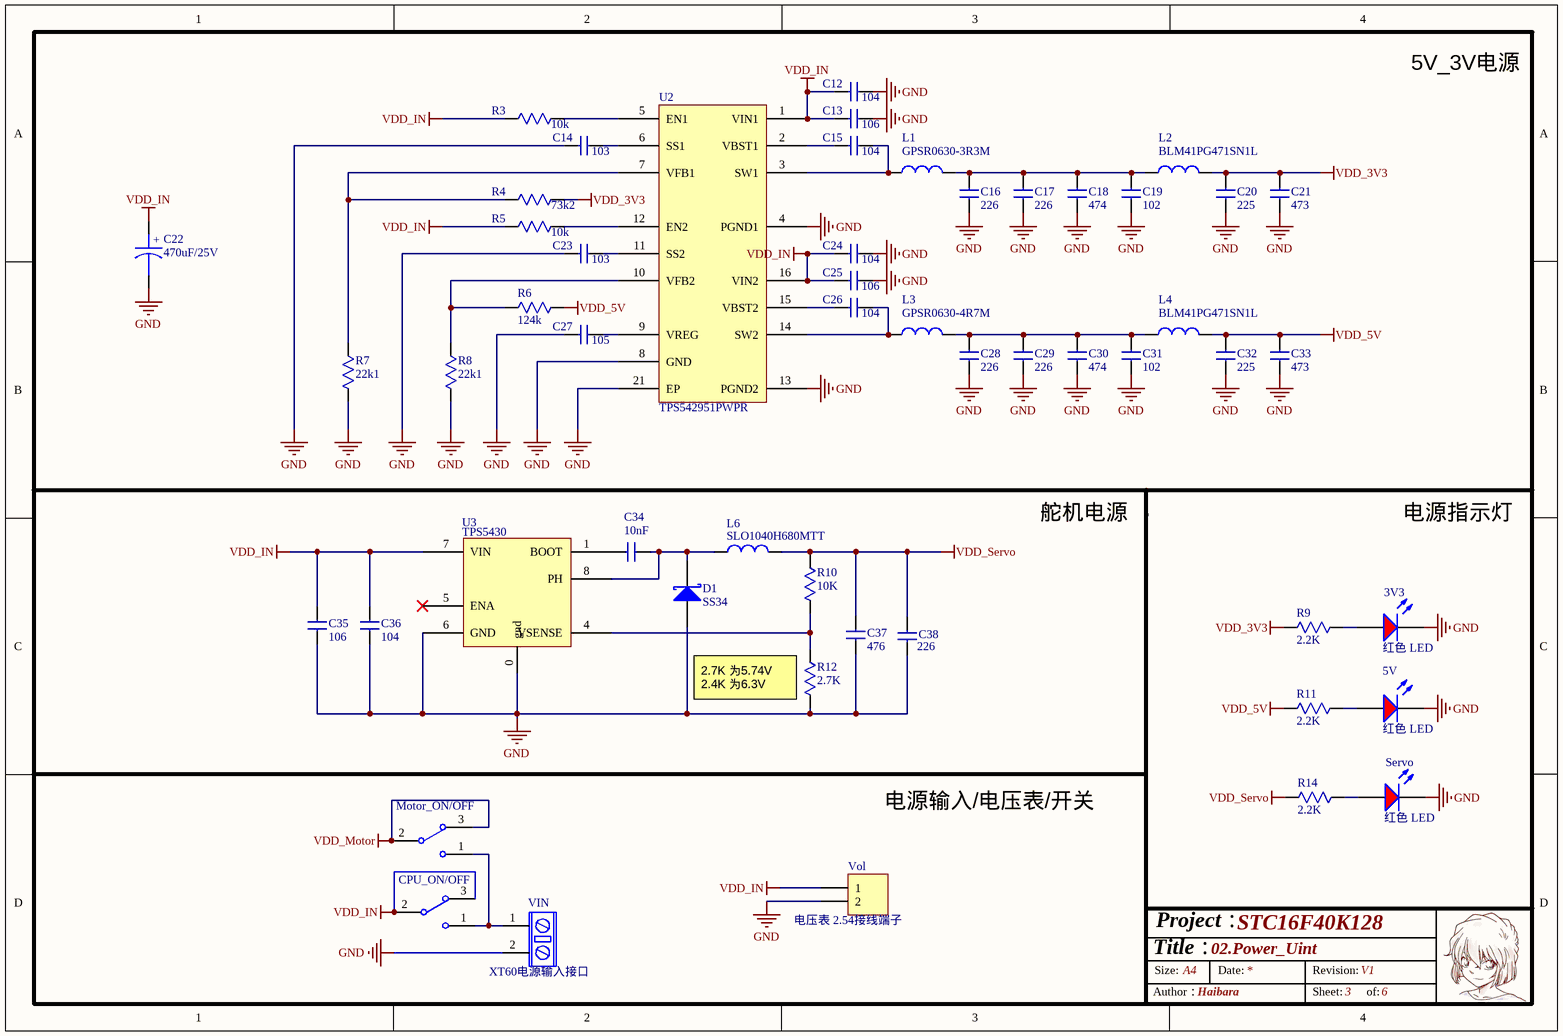
[diagram p4: 02.Power_Uint.SchDoc]

### Parts
3V3  红色 LED  [0603 LED R]
5V  红色 LED  [0603 LED R]
C12  104  [C0603]
C13  106  [C0805]
C14  103  [C0603]
C15  104  [C0805]
C16  226  [C0805]
C17  226  [C0805]
C18  474  [C0603]
C19  102  [C0603]
C20  225  [C0603]
C21  473  [C0603]
C22  470uF/25V  [CAP 2.5*6.3*11.2]
C23  103  [C0603]
C24  104  [C0603]
C25  106  [C0805]
C26  104  [C0805]
C27  105  [C0603]
C28  226  [C0805]
C29  226  [C0805]
C30  474  [C0603]
C31  102  [C0603]
C32  225  [C0603]
C33  473  [C0603]
C34  10nF  [C0603]
C35  106  [C0805]
C36  104  [C0603]
C37  476  [C0805]
C38  226  [C0805]
CPU_ON/OFF  SW-SPDT  [MTS-102S 两档纽子开关]  (value not drawn)
D1  SS34  [SMA]
L1  GPSR0630-3R3M  [L 0630]
L2  BLM41PG471SN1L  [R1206]
L3  GPSR0630-4R7M  [L 0630]
L4  BLM41PG471SN1L  [R1206]
L6  SLO1040H680MTT  [IND-SMD_L10.8-W10.0]
Motor_ON/OFF  SW-SPDT  [MTS-102S 两档纽子开关]  (value not drawn)
R3  10k  [R0603]
R4  73k2  [R0603]
R5  10k  [R0603]
R6  124k  [R0603]
R7  22k1  [R0603]
R8  22k1  [R0603]
R9  2.2K  [R0603]
R10  10K  [R0603]
R11  2.2K  [R0603]
R12  2.7K  [R0603]
R14  2.2K  [R0603]
Servo  红色 LED  [0603 LED R]
U2  TPS542951PWPR  [SSOP16_EP]
U3  TPS5430  [LC-SOP-8_EP_150mil]
VIN  XT60电源输入接口  [XT60 母头 电源接口]
Vol  电压表 2.54接线端子  [XH2.54-LI-2P]

### Nets
GND: 3V3.2 5V.2 C12.2 C13.2 C14.1 C16.1 C17.1 C18.1 C19.1 C20.1 C21.1 C22.2 C23.1 C24.2 C25.2 C27.1 C28.1 C29.1 C30.1 C31.1 C32.1 C33.1 C35.1 C36.1 C37.1 C38.1 D1.1(A) R7.1 R8.1 R12.1 Servo.2 U2.4(PGND1) U2.8(GND) U2.13(PGND2) U2.21(EP) U3.0(gnd) U3.6(GND) VIN.2 Vol.2
VDD_3V3: C20.2 C21.2 L2.2 R4.1 R9.1
VDD_5V: C32.2 C33.2 L4.2 R6.1 R11.1
VDD_IN: C12.1 C13.1 C22.1 C24.1 C25.1 C35.2 C36.2 CPU_ON/OFF.2 CPU_ON/OFF.3 R3.2 R5.2 U2.1(VIN1) U2.16(VIN2) U3.7(VIN) Vol.1
VDD_Motor: Motor_ON/OFF.2 Motor_ON/OFF.3
VDD_Servo: C37.2 C38.2 L6.2 R10.2 R14.1
Net3V3_1: 3V3.1 R9.2
Net5V_1: 5V.1 R11.2
NetC14_2: C14.2 U2.6(SS1)
NetC15_1: C15.1 U2.2(VBST1)
NetC15_2: C15.2 L1.1 U2.3(SW1)
NetC16_2: C16.2 C17.2 C18.2 C19.2 L1.2 L2.1
NetC23_2: C23.2 U2.11(SS2)
NetC26_1: C26.1 U2.15(VBST2)
NetC26_2: C26.2 L3.1 U2.14(SW2)
NetC27_2: C27.2 U2.9(VREG)
NetC28_2: C28.2 C29.2 C30.2 C31.2 L3.2 L4.1
NetC34_1: C34.1 D1.2(K) L6.1 U3.8(PH)
NetC34_2: C34.2 U3.1(BOOT)
NetCPU_ON/OFF_1: CPU_ON/OFF.1 Motor_ON/OFF.1 VIN.1
NetR3_1: R3.1 U2.5(EN1)
NetR4_2: R4.2 R7.2 U2.7(VFB1)
NetR5_1: R5.1 U2.12(EN2)
NetR6_2: R6.2 R8.2 U2.10(VFB2)
NetR10_1: R10.1 R12.2 U3.4(VSENSE)
NetR14_2: R14.2 Servo.1

Not connected (* = marked no-connect by the designer): U3 5(ENA)*

### Notes on the sheet
- (near R12) 2.7K 为5.74V
  2.4K 为6.3V
- Labels drawn without touching a wire or pin: 5V_3V电源, 电源指示灯, 电源输入/电压表/开关, 舵机电源
- Title：
- Size:
- Project：
- A4
- Date:
- Revision:
- Author：
- Haibara
- Sheet:
- of:
- (in symbol CAP POL) +
- (in symbol Cap Pol2) 16V

### Library data of the parts
3V3 5V Servo = 红灯: 发光二极管; ComponentLink1Description: 供应商链接; ComponentLink1URL: http://www.szlcsc.com/product/details_2668.html; Package: 0805; Supplier: LC; SuppliersPartNumber: C2295
C12-C21 C23-C38 = 电容
C22 = CAP POL: Capacitor
CPU_ON/OFF Motor_ON/OFF = SW-SPDT: SPDT Subminiature Toggle Switch, Right Angle Mounting, Vertical Actuation; Published: 24-Mar-1999; LatestRevisionDate: 17-Dec-2003; LatestRevisionNote: Schematic revised, PCB Footprint replaced.; DatasheetVersion: 05-Dec-2000; PackageReference: TL36WW15050; Publisher: Altium Limited; PackageDescription: Switch; 4 Leads; ComponentLink1Description: Manufacturer Link; ComponentLink1URL: http://www.apem.com
D1 = 肖特基二极管: as D4 on sheet 04.Input_Output; Published: 8-Jun-2000; LatestRevisionDate: 17-Jul-2002; LatestRevisionNote: Re-released for DXP Platform.; DatasheetVersion: PD-2.057B; PackageVersion: Feb-1998; PackageReference: TO-220AC; Publisher: Altium Limited; PackageDescription: TO, Thru-Hole, Vertical, Heatsink Mounted; 3 In-Line Leads (1 Absent); Pitch 2.54 mm; ComponentLink1Description: Manufacturer Link; ComponentLink1URL: http://www.irf.com/; ComponentLink2Description: Datasheet; ComponentLink2URL: http://www.irf.com/product-info/datasheets/data/10tq.pdf
L1 L3 L6 = 电感
L2 L4 = 磁珠: BLM18PG471SN1D
R3-R12 R14 = 电阻
U3 = TPS5410: 1-A, Wide Input Range, Step-Down Converter
VIN = 电机供电接口
Vol = Header 2: Header, 2-Pin; LatestRevisionDate: 17-Jul-2002; LatestRevisionNote: Re-released for DXP Platform.; Publisher: Altium Limited

## Sheet 05.Motor_Drive.schdoc: 06.Motor_Drive
size A4; Revision: V1; SheetNumber: 7; SheetTotal: 7; Project: STC16F40K128
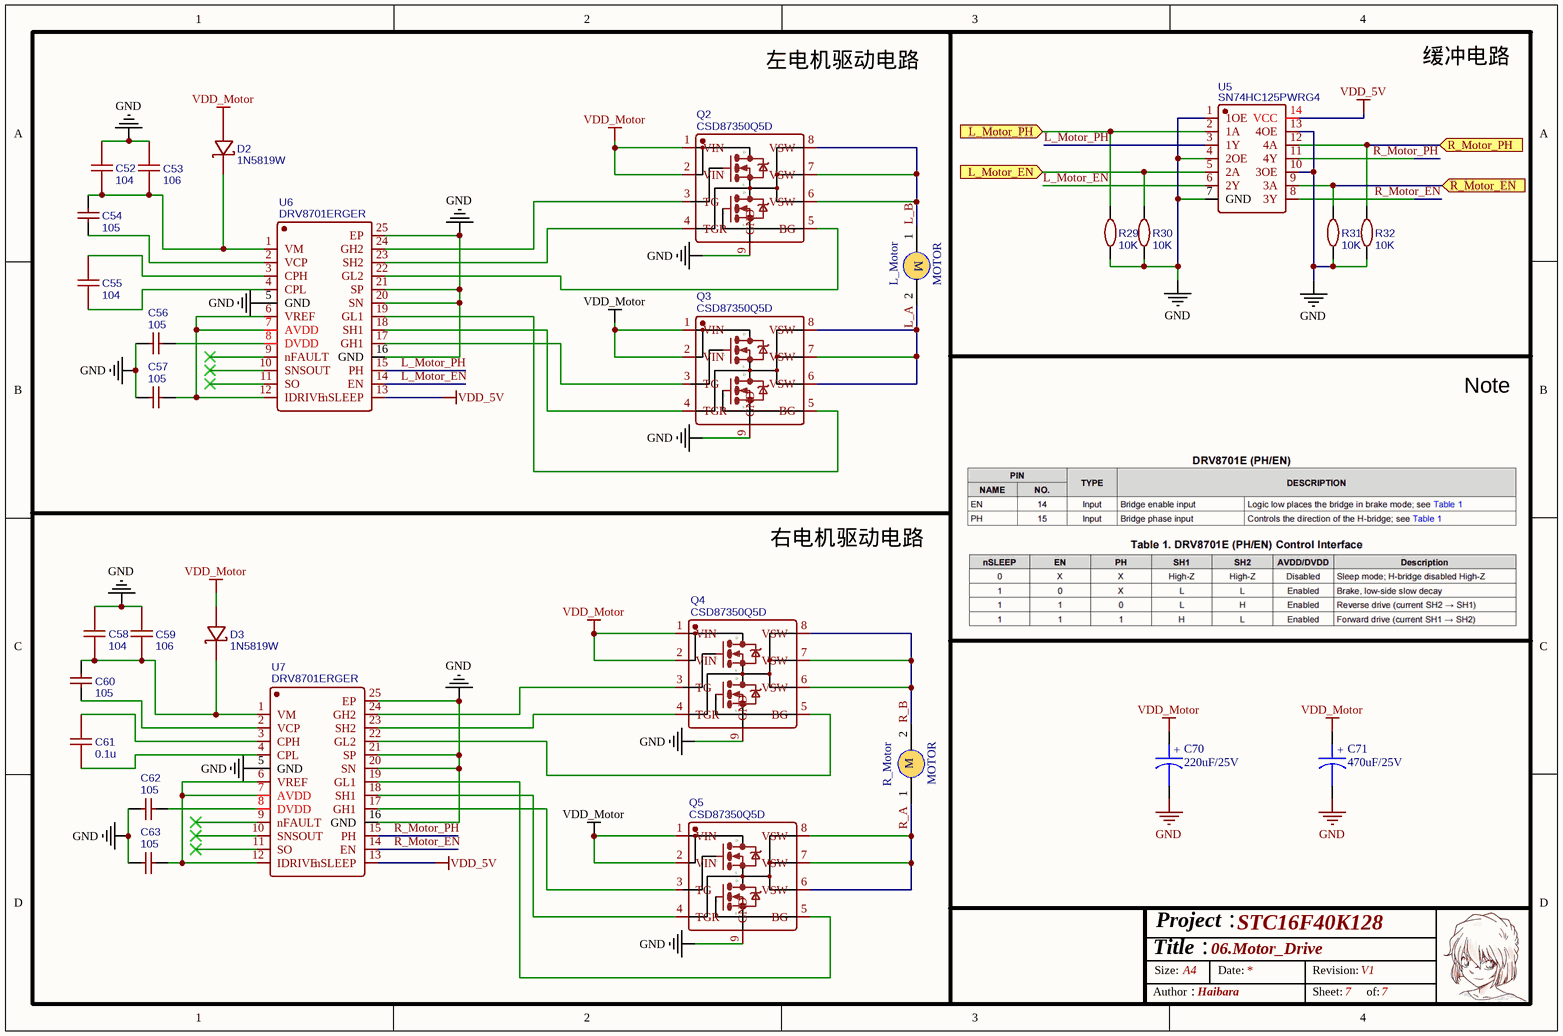
[diagram p5: 05.Motor_Drive.schdoc]

### Parts
C52  104  [C0603]
C53  106  [C0805]
C54  105  [C0603]
C55  104  [C0603]
C56  105  [C0603]
C57  105  [C0603]
C58  104  [C0603]
C59  106  [C0805]
C60  105  [C0603]
C61  0.1u  [C0603]
C62  105  [C0603]
C63  105  [C0603]
C70  220uF/25V  [CAP 2.5*6.3*11.2]
C71  470uF/25V  [CAP 3.5*8*11.5 - BK]
D2  1N5819W  [SOD-123F_L2.8-W1.8-LS3.7-RD]
D3  1N5819W  [SOD-123F_L2.8-W1.8-LS3.7-RD]
L_Motor  MOTOR  [XT30 母头 电源插头]
Q2  CSD87350Q5D  [LSON-8_L6.0-W5.0-P1.27-LS6.0-TL-EP]
Q3  CSD87350Q5D  [LSON-8_L6.0-W5.0-P1.27-LS6.0-TL-EP]
Q4  CSD87350Q5D  [LSON-8_L6.0-W5.0-P1.27-LS6.0-TL-EP]
Q5  CSD87350Q5D  [LSON-8_L6.0-W5.0-P1.27-LS6.0-TL-EP]
R29  10K  [R0603]
R30  10K  [R0603]
R31  10K  [R0603]
R32  10K  [R0603]
R_Motor  MOTOR  [XT30 母头 电源插头]
U5  SN74HC125PWRG4  [TSSOP-14_L5.0-W4.4-P0.65-LS6.4-TL]
U6  DRV8701ERGER  [VQFN-24_L4.0-W4.0-P0.50-BL-EP2.8]
U7  DRV8701ERGER  [VQFN-24_L4.0-W4.0-P0.50-BL-EP2.8]

### Ports
L_Motor_EN (in), L_Motor_PH (in), R_Motor_EN (in), R_Motor_PH (in)

### Nets
GND: C52.2 C53.1 C56.2 C57.2 C58.2 C59.1 C62.2 C63.1 C70.2 C71.2 Q2.9(GND) Q3.9(GND) Q4.9(GND) Q5.9(GND) R29.1 R30.1 R31.1 R32.1 U5.1(1OE) U5.4(2OE) U5.7(GND) U5.10(3OE) U5.13(4OE) U6.5(GND) U6.16(GND) U6.20(SN) U6.21(SP) U6.25(EP) U7.5(GND) U7.16(GND) U7.20(SN) U7.21(SP) U7.25(EP)
VDD_5V: U5.14(VCC) U6.13(nSLEEP) U7.13(nSLEEP)
VDD_Motor: C70.1 C71.1 D2.2 D3.2 Q2.1(VIN) Q2.2(VIN) Q3.1(VIN) Q3.2(VIN) Q4.1(VIN) Q4.2(VIN) Q5.1(VIN) Q5.2(VIN)
L_A: L_Motor.2 Q3.6(VSW) Q3.7(VSW) Q3.8(VSW)
L_B: L_Motor.1 Q2.6(VSW) Q2.7(VSW) Q2.8(VSW)
L_EN_P6.6: R30.2 U5.5(2A) ; port L_Motor_EN
L_Motor_EN: U5.6(2Y) U6.14(EN)
L_Motor_PH: U5.3(1Y) U6.15(PH)
L_PH_P6.7: R29.2 U5.2(1A) ; port L_Motor_PH
R_A: Q5.6(VSW) Q5.7(VSW) Q5.8(VSW) R_Motor.1
R_B: Q4.6(VSW) Q4.7(VSW) Q4.8(VSW) R_Motor.2
R_EN_P6.4: R31.2 U5.9(3A) ; port R_Motor_EN
R_Motor_EN: U5.8(3Y) U7.14(EN)
R_Motor_PH: U5.11(4Y) U7.15(PH)
R_PH_P6.5: R32.2 U5.12(4A) ; port R_Motor_PH
NetC52_1: C52.1 C53.2 C54.2 D2.1 U6.1(VM)
NetC54_1: C54.1 U6.2(VCP)
NetC55_1: C55.1 U6.4(CPL)
NetC55_2: C55.2 U6.3(CPH)
NetC56_1: C56.1 U6.8(DVDD)
NetC57_1: C57.1 U6.6(VREF) U6.7(AVDD) U6.12(IDRIVE)
NetC58_1: C58.1 C59.2 C60.2 D3.1 U7.1(VM)
NetC60_1: C60.1 U7.2(VCP)
NetC61_1: C61.1 U7.4(CPL)
NetC61_2: C61.2 U7.3(CPH)
NetC62_1: C62.1 U7.8(DVDD)
NetC63_2: C63.2 U7.6(VREF) U7.7(AVDD) U7.12(IDRIVE)
NetQ2_3: Q2.3(TG) U6.24(GH2)
NetQ2_4: Q2.4(TGR) U6.23(SH2)
NetQ2_5: Q2.5(BG) U6.22(GL2)
NetQ3_3: Q3.3(TG) U6.17(GH1)
NetQ3_4: Q3.4(TGR) U6.18(SH1)
NetQ3_5: Q3.5(BG) U6.19(GL1)
NetQ4_3: Q4.3(TG) U7.24(GH2)
NetQ4_4: Q4.4(TGR) U7.23(SH2)
NetQ4_5: Q4.5(BG) U7.22(GL2)
NetQ5_3: Q5.3(TG) U7.17(GH1)
NetQ5_4: Q5.4(TGR) U7.18(SH1)
NetQ5_5: Q5.5(BG) U7.19(GL1)

Not connected (* = marked no-connect by the designer): U6 9(nFAULT)* 10(SNSOUT)* 11(SO)*; U7 9(nFAULT)* 10(SNSOUT)* 11(SO)*

### Notes on the sheet
- 左电机驱动电路
- 缓冲电路
- Note
- 右电机驱动电路
- Title：
- Size:
- Project：
- A4
- Date:
- Revision:
- Author：
- Haibara
- Sheet:
- of:
- (in symbol CAP POL) +
- (in symbol MOTOR1) M

### Library data of the parts
C52 C55 C58 C61 = 0.1u: nameAlias: Value(F); Contributor: LCEDA_Lib; spicePre: C; spiceSymbolName: C_0603_US
C53 C59 = 10uF: BOM_Manufacturer: Huaxin S&T; BOM_Manufacturer Part: 0805F106Z160CT; nameAlias: Capacitance; Contributor: LCSC; BOM_Supplier: LCSC; BOM_Supplier Part: C303921; BOM_JLCPCB Part Class: Extended Part; spicePre: C; spiceSymbolName: 0805F106Z160CT
C54 C56 C57 C60 C62 C63 = 1uF: BOM_Manufacturer Part: CL10B105KO8NNNC; BOM_Manufacturer: SAMSUNG; nameAlias: Capacitance; BOM_Supplier: LCSC; BOM_Supplier Part: C59782; BOM_JLCPCB Part Class: Extended Part; spicePre: C; spiceSymbolName: CL10B105KO8NNNC
C70 C71 = CAP POL: Capacitor
D2 D3 = 1N5819W: BOM_Manufacturer: Shandong Jingdao Microelectronics; Contributor: LCSC; BOM_Supplier: LCSC; BOM_Supplier Part: C169540; BOM_Manufacturer Part: 1N5819W; BOM_JLCPCB Part Class: Extended Part; spicePre: D; spiceSymbolName: 1N5819W
L_Motor R_Motor = MOTOR1
Q2-Q5 = CSD87350Q5D: BOM_Manufacturer: Texas Instruments; Contributor: LCSC; BOM_Supplier: LCSC; BOM_Supplier Part: C140356; BOM_Manufacturer Part: CSD87350Q5D; BOM_JLCPCB Part Class: Extended Part; spicePre: Q; spiceSymbolName: CSD87350Q5D
R29-R32 = 10K: BOM_Manufacturer: YAGEO; BOM_Manufacturer Part: RT0603BRD0710KL; nameAlias: Resistance (Ohms); Resistance: 10kΩ; BOM_Supplier: LCSC; BOM_Supplier Part: C95204; BOM_JLCPCB Part Class: Extended Part; spicePre: R; spiceSymbolName: RT0603BRD0710KL
U5 = SN74HC125PWRG4: BOM_Manufacturer: TI(德州仪器); Contributor: LCSC; BOM_Supplier: LCSC; BOM_Supplier Part: C2676184; BOM_Manufacturer Part: SN74HC125PWRG4; BOM_JLCPCB Part Class: Extended Part; spicePre: U; spiceSymbolName: SN74HC125PWRG4
U6 U7 = DRV8701ERGER: BOM_Manufacturer: Texas Instruments; Contributor: LCSC; BOM_Supplier: LCSC; BOM_Supplier Part: C90964; BOM_Manufacturer Part: DRV8701ERGER; BOM_JLCPCB Part Class: Extended Part; spicePre: U; spiceSymbolName: DRV8701ERGER

## Nets that join several sheets
GND: 01.STC16F40K128_MCU (13 pins), 03.Communicate (16 pins), 04.Input_Output (23 pins), 02.Power_Uint (39 pins), 05.Motor_Drive (33 pins)
VDD_3V3: 04.Input_Output (C2.1 IPS.2), 02.Power_Uint (5 pins)
VDD_5V: 01.STC16F40K128_MCU (FB1.1 Q6.3 R1.1), 03.Communicate (R19.1 R20.1 R22.1 R26.2), 04.Input_Output (18 pins), 02.Power_Uint (5 pins), 05.Motor_Drive (U5.14 U6.13 U7.13)
VDD_Motor: 02.Power_Uint (Motor_ON/OFF.2 Motor_ON/OFF.3), 05.Motor_Drive (12 pins)
VDD_Servo: 04.Input_Output (D4.1), 02.Power_Uint (5 pins)
ADC0_P1.0: 01.STC16F40K128_MCU (U4.9), 04.Input_Output (A-电磁采集-B.18)
ADC1_P1.1: 01.STC16F40K128_MCU (U4.10), 04.Input_Output (A-电磁采集-B.15)
ADC3_P1.3: 01.STC16F40K128_MCU (U4.16), 04.Input_Output (A-电磁采集-B.7)
ADC4_P1.4: 01.STC16F40K128_MCU (U4.12), 04.Input_Output (A-电磁采集-B.16)
ADC5_P1.5: 01.STC16F40K128_MCU (U4.13), 04.Input_Output (A-电磁采集-B.13)
ADC6_P1.6: 01.STC16F40K128_MCU (U4.14), 04.Input_Output (A-电磁采集-B.14)
ADC7_P1.7: 01.STC16F40K128_MCU (U4.15), 04.Input_Output (A-电磁采集-B.8)
ADC10_P0.2: 01.STC16F40K128_MCU (U4.61), 04.Input_Output (A-电磁采集-B.20)
ADC11_P0.3: 01.STC16F40K128_MCU (U4.62), 04.Input_Output (A-电磁采集-B.19)
ADC13_P0.5: 01.STC16F40K128_MCU (U4.2), 04.Input_Output (A-电磁采集-B.17)
BUZZER_P4.0: 01.STC16F40K128_MCU (U4.22), 03.Communicate (R27.1 R28.1)
DIP_SWITCH_P0.7: 01.STC16F40K128_MCU (U4.4), 03.Communicate (R18.1)
DIP_SWITCH_P6.0: 01.STC16F40K128_MCU (U4.5), 03.Communicate (R17.1)
DIP_SWITCH_P6.1: 01.STC16F40K128_MCU (U4.6), 03.Communicate (R16.1)
DIP_SWITCH_P6.2: 01.STC16F40K128_MCU (U4.7), 03.Communicate (R15.1)
Hallwee_P7.1: 01.STC16F40K128_MCU (U4.38), 04.Input_Output (Hallwee.2)
IMU_P4.1: 01.STC16F40K128_MCU (U4.42), 04.Input_Output (陀螺仪.5)
IMU_P4.2: 01.STC16F40K128_MCU (U4.41), 04.Input_Output (陀螺仪.4)
IMU_P4.3: 01.STC16F40K128_MCU (U4.43), 04.Input_Output (陀螺仪.6)
IPS_P2.0: 01.STC16F40K128_MCU (U4.45), 04.Input_Output (IPS.8)
IPS_P2.1: 01.STC16F40K128_MCU (U4.46), 04.Input_Output (IPS.7)
IPS_P2.2: 01.STC16F40K128_MCU (U4.47), 04.Input_Output (IPS.6)
IPS_P2.3: 01.STC16F40K128_MCU (U4.48), 04.Input_Output (IPS.4)
IPS_P2.5: 01.STC16F40K128_MCU (U4.50), 04.Input_Output (IPS.3)
IPS_P2.7: 01.STC16F40K128_MCU (U4.52), 04.Input_Output (IPS.5)
L_EN_P6.6: 01.STC16F40K128_MCU (U4.25), 05.Motor_Drive (R30.2 U5.5)
L_ENC_P0.4: 01.STC16F40K128_MCU (U4.63), 04.Input_Output (编码器左.3)
L_ENC_P5.2: 01.STC16F40K128_MCU (U4.64), 04.Input_Output (编码器左.4)
L_PH_P6.7: 01.STC16F40K128_MCU (U4.26), 05.Motor_Drive (R29.2 U5.2)
LED_B_P5.1: 01.STC16F40K128_MCU (U4.33), 03.Communicate (BLUE.2)
LED_G_P3.5: 01.STC16F40K128_MCU (U4.34), 03.Communicate (GREEN.2)
LED_R_P7.0: 01.STC16F40K128_MCU (U4.37), 03.Communicate (RED.2)
R_EN_P6.4: 01.STC16F40K128_MCU (U4.23), 05.Motor_Drive (R31.2 U5.9)
R_ENC_P3.4: 01.STC16F40K128_MCU (U4.31), 04.Input_Output (编码器右.3)
R_ENC_P5.0: 01.STC16F40K128_MCU (U4.32), 04.Input_Output (编码器右.4)
R_PH_P6.5: 01.STC16F40K128_MCU (U4.24), 05.Motor_Drive (R32.2 U5.12)
RTS_P2.6: 01.STC16F40K128_MCU (U4.51), 04.Input_Output (无线串口.4)
Servo_P3.3: 01.STC16F40K128_MCU (U4.30), 04.Input_Output (舵机.1)
SWITCH_P7.4: 01.STC16F40K128_MCU (U4.53), 03.Communicate (R21.1)
SWITCH_P7.5: 01.STC16F40K128_MCU (U4.54), 03.Communicate (R23.1)
SWITCH_P7.6: 01.STC16F40K128_MCU (U4.55), 03.Communicate (R24.1)
SWITCH_P7.7: 01.STC16F40K128_MCU (U4.56), 03.Communicate (R25.1)
UART1_RXD_P3.6: 01.STC16F40K128_MCU (U4.35), 04.Input_Output (USART_A.3)
UART1_TXD_P3.7: 01.STC16F40K128_MCU (U4.36), 04.Input_Output (USART_A.4)
UART2_RX_P4.6: 01.STC16F40K128_MCU (U4.58), 04.Input_Output (USART_B.3)
UART2_TX_P4.7: 01.STC16F40K128_MCU (U4.11), 04.Input_Output (USART_B.4)
UART3_RX_P0.0: 01.STC16F40K128_MCU (U4.59), 04.Input_Output (无线串口.3)
UART3_TX_P0.1: 01.STC16F40K128_MCU (U4.60), 04.Input_Output (无线串口.1)